# EAGLE schematic census (EAGLE 9.6.2)
Census schematic: a sensor with a buffer gate.
AUTHOR: Census
Assembly variants: LITE, FULL

## Sheet 1 of 2: Sheet one: the sensor.
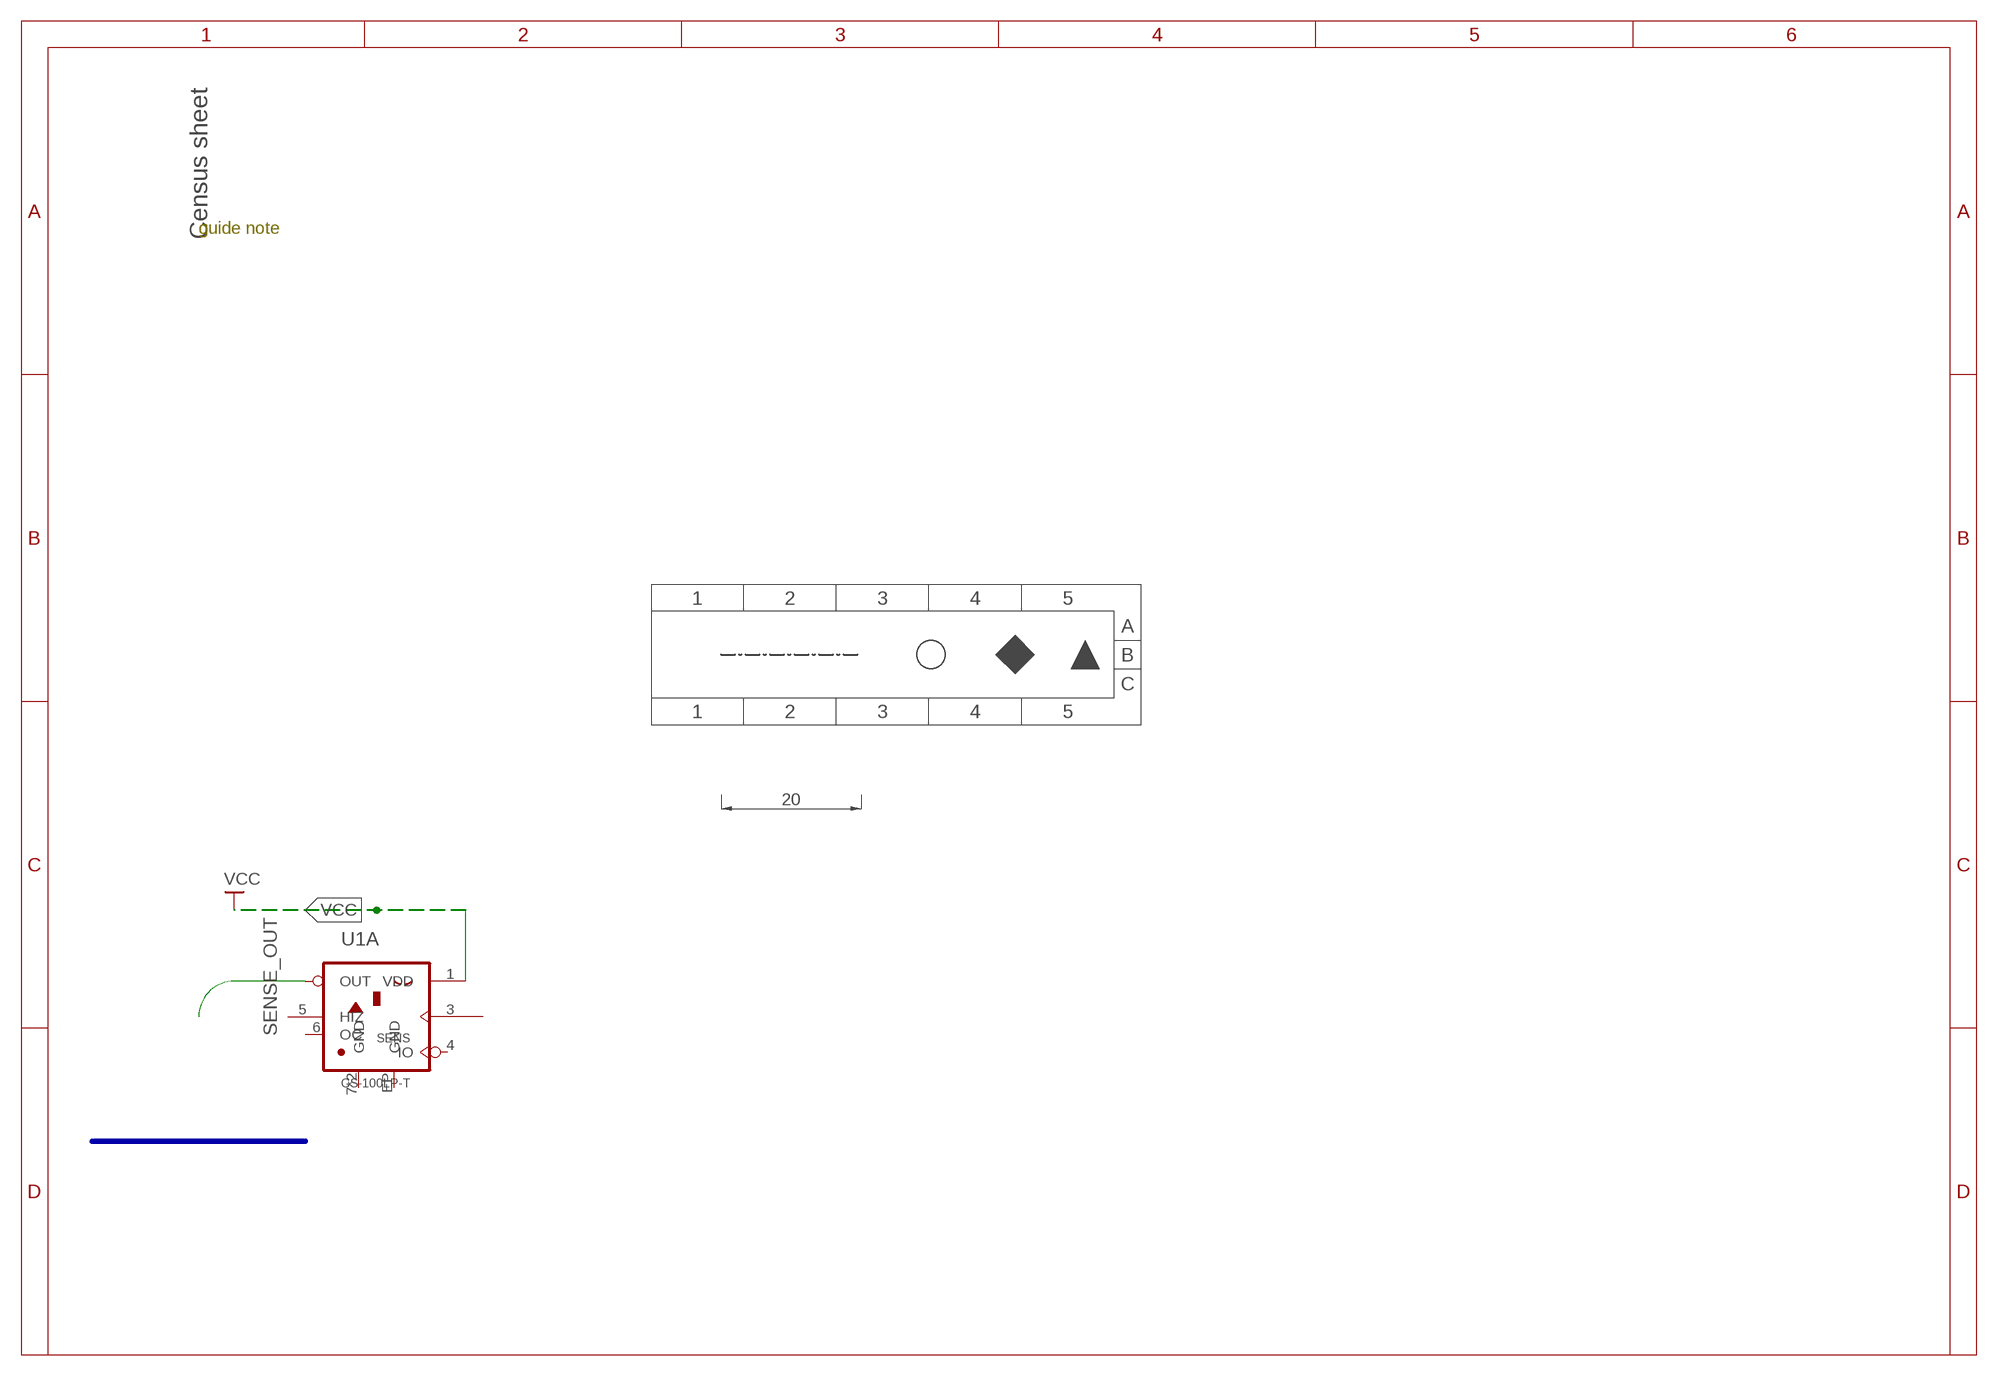
[diagram p0: schematic, sheet 1]

### Parts
U1  CS-100LP  SENSORLP-QFN  [QFN11]  (not fitted in variant LITE)  (variant FULL: CS-100HP)

### Nets
SENSE_OUT: U1.2(A:OUT) ; also sheet 2
VCC [power]: U1.1(A:VDD)
Unconnected: U1.3(A:EN) U1.4(A:IO) U1.5(A:HIZ) U1.6(A:OC)

### Buses
D[0..3]

### Notes on the sheet
- Census sheet
- guide note

## Sheet 2 of 2: Sheet two: the buffer gate.
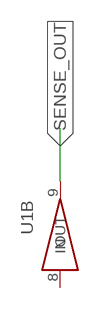
[diagram p1: schematic, sheet 2]

### Nets
SENSE_OUT: U1.9(B:OUT) ; also sheet 1
Unconnected: U1.8(B:IN)

## Power pins joined to a net without a drawn wire
GND: U1.7(A:GND) U1.B1(A:GND) U1.EP(A:GND)

## Library data of the parts
U1 = census-lib:SENSOR*: Census sensor in two technologies.; MPN: CS-100LP-T; NOTE: hand-solder; POWER: 1mW

## Net classes
1 power: width 0.5 mm, drill 0.4 mm, clearance 0.3 mm